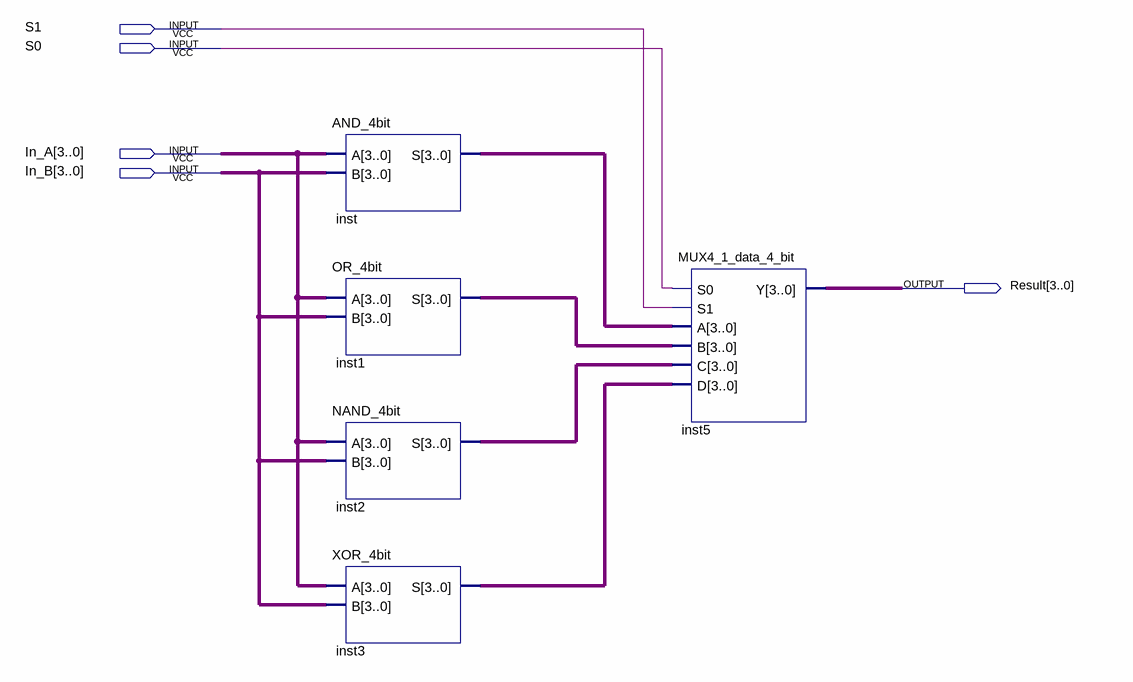
[diagram p0: schematic sheet]
// Quartus schematic LU.bdf as structural Verilog: 5 symbols, 5 pins
module LU (
  input  S1,
  input  S0,
  input  [3:0] In_A,
  input  [3:0] In_B,
  output [3:0] Result
);

  wire [3:0] inst1_s, inst2_s, inst3_s, inst_s;

  AND_4bit inst (.A(In_A), .B(In_B), .S(inst_s));
  OR_4bit inst1 (.A(In_A), .B(In_B), .S(inst1_s));
  NAND_4bit inst2 (.A(In_A), .B(In_B), .S(inst2_s));
  XOR_4bit inst3 (.A(In_A), .B(In_B), .S(inst3_s));
  MUX4_1_data_4_bit inst5 (.S0(S0), .S1(S1), .A(inst_s), .B(inst1_s), .C(inst2_s), .D(inst3_s), .Y(Result));
endmodule
